# Altium schematic sheet HMS.STM32L151CBT6.SchDoc
size A3
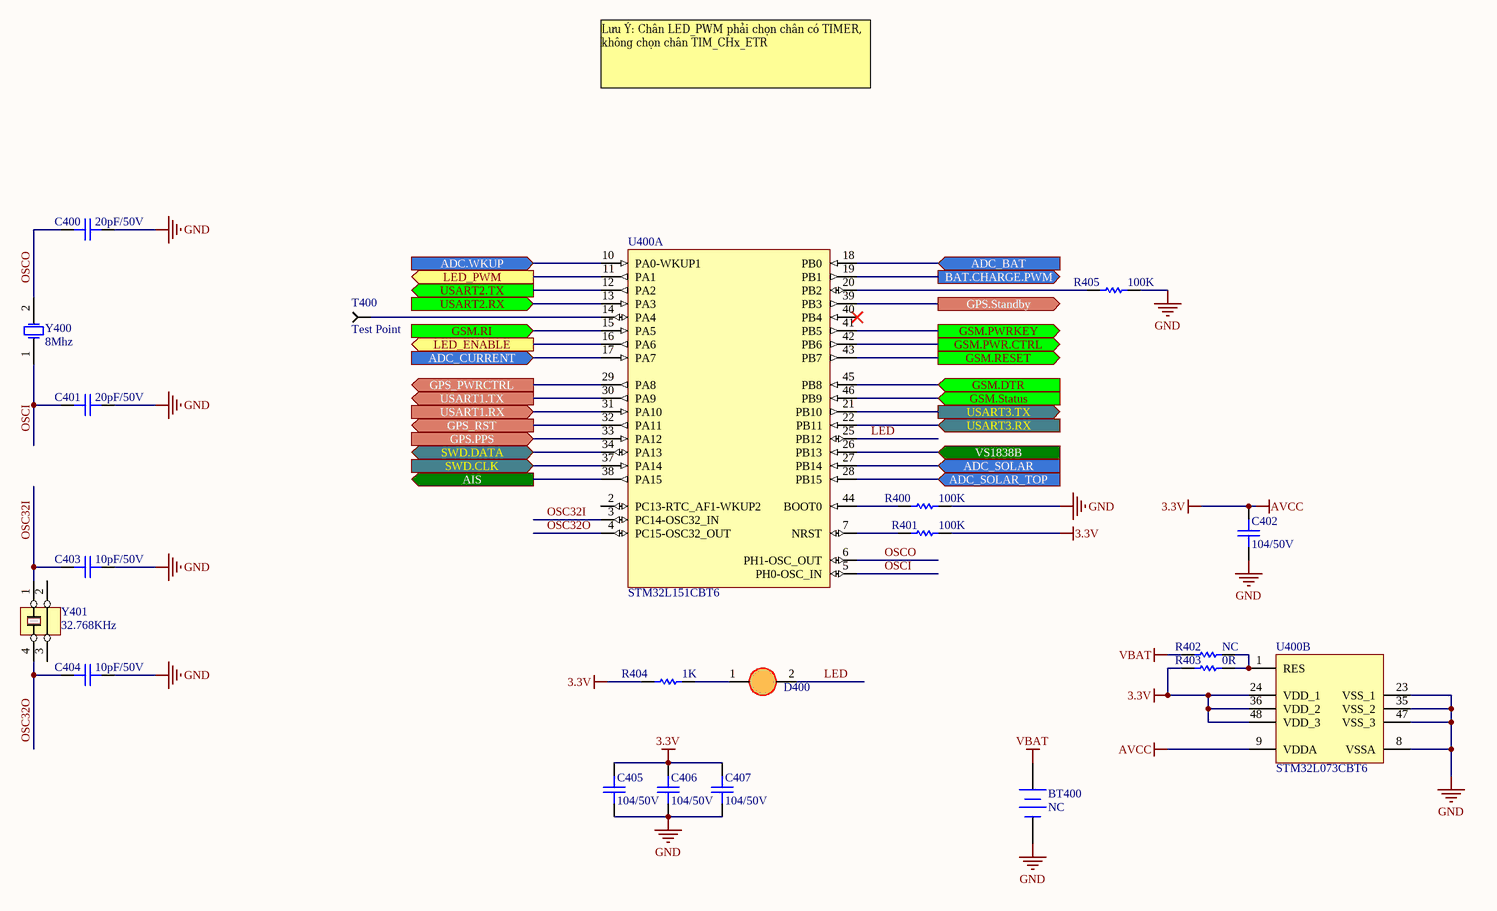
[diagram p0: HMS.STM32L151CBT6.SchDoc]

## Parts
BT400  NC  [DE PIN NHO 3V3]
C400  20pF/50V  [CAP_CERAMIC_0402(1005)]
C401  20pF/50V  [CAP_CERAMIC_0402(1005)]
C402  104/50V  [CAP_CERAMIC_0402(1005)]
C403  10pF/50V  [CAP_CERAMIC_0402(1005)]
C404  10pF/50V  [CAP_CERAMIC_0402(1005)]
C405  104/50V  [CAP_CERAMIC_0402(1005)]
C406  104/50V  [CAP_CERAMIC_0402(1005)]
C407  104/50V  [CAP_CERAMIC_0402(1005)]
D400  LED Red  [LED_0603_GREEN]  (value not drawn)
R400  100K  [RES_0402(1005)]
R401  100K  [RES_0402(1005)]
R402  NC  [RES_0402(1005)]
R403  0R  [RES_0402(1005)]
R404  1K  [RES_0402(1005)]
R405  100K  [RES_0402(1005)]
T400  Test Point  [Test Point SMD]
U400  STM32L151CBT6  [LQFP48_L]  (parts A,B of 2)
Y400  8Mhz  [CRYSTAL_SMD_2PIN-5032]
Y401  32.768KHz  [ABS25-32768-6-T]

## Ports
ADC.WKUP (in), ADC_BAT (in), ADC_CURRENT (in), ADC_SOLAR (in), ADC_SOLAR_TOP (in), AIS (out), BAT.CHARGE.PWM (out), GPS.PPS (in), GPS.Standby (out), GPS_PWRCTRL (out), GPS_RST (out), GSM.DTR (in), GSM.PWR.CTRL (out), GSM.PWRKEY (out), GSM.RESET (out), GSM.RI (in), GSM.Status (in), LED_ENABLE (out), LED_PWM (out), SWD.CLK (in), SWD.DATA (bidir), USART1.RX (in), USART1.TX (out), USART2.RX (in), USART2.TX (out), USART3.RX (in), USART3.TX (out), VS1838B (in)

## Nets
3.3V: C402.2 C405.2 C406.2 C407.2 R401.2 R403.1 R404.1 U400.9(VDDA) U400.24(VDD_1) U400.36(VDD_2) U400.48(VDD_3)  [also labelled AVCC]
GND: BT400.2(-) C400.1 C401.1 C402.1 C403.1 C404.1 C405.1 C406.1 C407.1 R400.1 R405.1 U400.8(VSSA) U400.23(VSS_1) U400.35(VSS_2) U400.47(VSS_3)
VBAT: BT400.1(+) R402.1
ADC.WKUP: U400.10(PA0-WKUP1) ; port ADC.WKUP
ADC_BAT: U400.18(PB0) ; port ADC_BAT
ADC_CURRENT: U400.17(PA7) ; port ADC_CURRENT
ADC_SOLAR: U400.27(PB14) ; port ADC_SOLAR
ADC_SOLAR_TOP: U400.28(PB15) ; port ADC_SOLAR_TOP
AIS: U400.38(PA15) ; port AIS
BAT.CHARGE.PWM: U400.19(PB1) ; port BAT.CHARGE.PWM
GPS.PPS: U400.33(PA12) ; port GPS.PPS
GPS.Standby: U400.39(PB3) ; port GPS.Standby
GPS_PWRCTRL: U400.29(PA8) ; port GPS_PWRCTRL
GPS_RST: U400.32(PA11) ; port GPS_RST
GSM.DTR: U400.45(PB8) ; port GSM.DTR
GSM.PWR.CTRL: U400.42(PB6) ; port GSM.PWR.CTRL
GSM.PWRKEY: U400.41(PB5) ; port GSM.PWRKEY
GSM.RESET: U400.43(PB7) ; port GSM.RESET
GSM.RI: U400.15(PA5) ; port GSM.RI
GSM.Status: U400.46(PB9) ; port GSM.Status
LED: D400.2(K) U400.25(PB12)
LED_ENABLE: U400.16(PA6) ; port LED_ENABLE
LED_PWM: U400.11(PA1) ; port LED_PWM
OSC32I: C403.2 U400.3(PC14-OSC32_IN) Y401.1
OSC32O: C404.2 U400.4(PC15-OSC32_OUT) Y401.4
OSCI: C401.2 U400.5(PH0-OSC_IN) Y400.1(OSC1)
OSCO: C400.2 U400.6(PH1-OSC_OUT) Y400.2(OSC2)
SWD.CLK: U400.37(PA14) ; port SWD.CLK
SWD.DATA: U400.34(PA13) ; port SWD.DATA
USART1.RX: U400.31(PA10) ; port USART1.RX
USART1.TX: U400.30(PA9) ; port USART1.TX
USART2.RX: U400.13(PA3) ; port USART2.RX
USART2.TX: U400.12(PA2) ; port USART2.TX
USART3.RX: U400.22(PB11) ; port USART3.RX
USART3.TX: U400.21(PB10) ; port USART3.TX
VS1838B: U400.26(PB13) ; port VS1838B
NetD400_1: D400.1(A) R404.2
NetR400_2: R400.2 U400.44(BOOT0)
NetR401_1: R401.1 U400.7(NRST)
NetR402_2: R402.2 R403.2 U400.1(RES)
NetR405_2: R405.2 U400.20(PB2)
NetT400_1: T400.1 U400.14(PA4)

Not connected (* = marked no-connect by the designer): U400 2(PC13-RTC_AF1-WKUP2) 40(PB4)*; Y401 2 3

## Notes on the sheet
- Lưu Ý: Chân LED_PWM phải chọn chân có TIMER, không chọn chân TIM_CHx_ETR

## Library data of the parts
BT400 = Battery: Published: 24-Mar-1999; LatestRevisionDate: 17-Jul-2002; LatestRevisionNote: Re-released for DXP Platform.; PackageReference: BAT-2; Publisher: Altium Limited; PackageDescription: Battery; 2 Leads; Value: NC
C400 C401 = Cap Cer 0603 (1608): CAP CER 20PF 50V C0G/NP0 0402; MPN: CQ0402FRNPO9BN200; Published: 8-Jun-2000; LatestRevisionDate: 17-Jul-2002; LatestRevisionNote: Re-released for DXP Platform.; PackageReference: RAD-0.3; Publisher: Altium Limited; Value: 20pF/50V
C402 C405-C407 = C0603C104K5RACTU: CAP CER 0.1UF 50V X5R 0402; MPN: CC0402KRX5R9BB104; CompanyID: VT-00982; Solder: SMT; Value: 104/50V; Category: CAPACITOR
C403 C404 = Cap Cer 0603 (1608): CAP CER 10pF 50V NP0 0402; MPN: CC0402JRNPO9BN100; Published: 8-Jun-2000; LatestRevisionDate: 17-Jul-2002; LatestRevisionNote: Re-released for DXP Platform.; PackageReference: RAD-0.3; Publisher: Altium Limited; Value: 10pF/50V
D400 = LED 3mm: LED RED SMD 0402; MPN: NCD0603R1; Value: LED Red
R400 R401 R405 = Res1: Resistor 100K 1/8W 1% 0402; MPN: RC0402FR-07100KL; Published: 8-Jun-2000; LatestRevisionDate: 17-Jul-2002; LatestRevisionNote: Re-released for DXP Platform.; PackageReference: AXIAL-0.3; Publisher: Altium Limited; Value: 100K
R402 = Res1: Resistor; Published: 8-Jun-2000; LatestRevisionDate: 17-Jul-2002; LatestRevisionNote: Re-released for DXP Platform.; PackageReference: AXIAL-0.3; Publisher: Altium Limited; Value: NC
R403 = Res1: RES 0 OHM 1/8W 0402; MPN: CRCW04020000Z0EDC; Published: 8-Jun-2000; LatestRevisionDate: 17-Jul-2002; LatestRevisionNote: Re-released for DXP Platform.; PackageReference: AXIAL-0.3; Publisher: Altium Limited; Value: 0R
R404 = Res1: RES 1K OHM 1% 1/8W 0402; MPN: RC0402FR-071KL; Published: 8-Jun-2000; LatestRevisionDate: 17-Jul-2002; LatestRevisionNote: Re-released for DXP Platform.; PackageReference: AXIAL-0.3; Publisher: Altium Limited; Value: 1K
U400 = STM32L151CBT6: STM32L ARM-based EnergyLite 32-bit MCU, 128 kB Flash, 16 kB Internal RAM, -40 to +85°C Temperature, 32-pin LQFP, Tray; DatasheetVersion: rev6, Jan-2012; PackageVersion: rev13, Apr-2011; PackageReference: LQFP48; PackageDescription: 48-Pin Low-Profile Quad Flat Pack, 7 x 7 mm Body, 0.5 mm Pitch (LQFP48); ComponentLink1Description: Manufacturer URL; ComponentLink1URL: http://www.st.com/; ComponentLink2Description: STM32L151/152 Datasheet; ComponentLink2URL: http://www.st.com/internet/com/TECHNICAL_RESOURCES/TECHNICAL_LITERATURE/DATASHEET/CD00277537.pdf; ComponentLink3Description: STM32 L1 Family Web Page; ComponentLink3URL: http://www.st.com/internet/mcu/subclass/1376.jsp; Value: STM32L151CBT6; MPN: STM32L151CBT6
Y400 = XTAL: Crystal 8Mhz 20pF SMD 5032; MPN: ABM3-8.000MHz-12-D4Y-T; Published: 8-Jun-2000; LatestRevisionDate: 17-Jul-2002; LatestRevisionNote: Re-released for DXP Platform.; PackageReference: R38; Publisher: Altium Limited; PackageDescription: Crystal, Thru-Hole; 2 Leads; Body 3.1 x 8.2 mm (Dia.xH); Value: 8Mhz
Y401 = ABS25-32768-6-T: CRYSTAL 32.768KHZ 6PF SMD; Manufacturer: Abracon Corporation; Manufacturer Part Number: ABS25-32.768KHZ-6-T; Frequency Tolerance: ±20ppm; ESR (Equivalent Series Resistance): 50 kOhm; Operating Mode: Fundamental; Supplier 1: Digi-Key; RoHS: RoHS Compliant; Category: Crystals and Oscillators; Stock 1: 51000; Pricing 1: 3000=0.285, 6000=0.2755, 15000=0.266 (USD); Packaging: Tape & Reel (TR); Type: kHz Crystal (Tuning Fork); Frequency: 32.768kHz; Frequency Stability: -; Load Capacitance: 6pF; Operating Temperature: -40°C ~ 85°C; Ratings: -; Mounting Type: Surface Mount; Package / Case: 4-SOJ, 5.50mm pitch; Size / Dimension: 0.315" L x 0.150" W (8.00mm x 3.80mm); Height: 0.098" (2.50mm); ComponentLink1URL: http://www.abracon.com/Resonators/abs25.pdf; ComponentLink1Description: http://www.abracon.com/Resonators/abs25.pdf; Supplier Part Number 1: 535-10240-2-ND; Value: 32.768KHz; MPN: ABS25-32768-6-T